# Altium project Industrial_IOT_Dev_Brd-v1.0.PrjPcb (part 1 of 7)
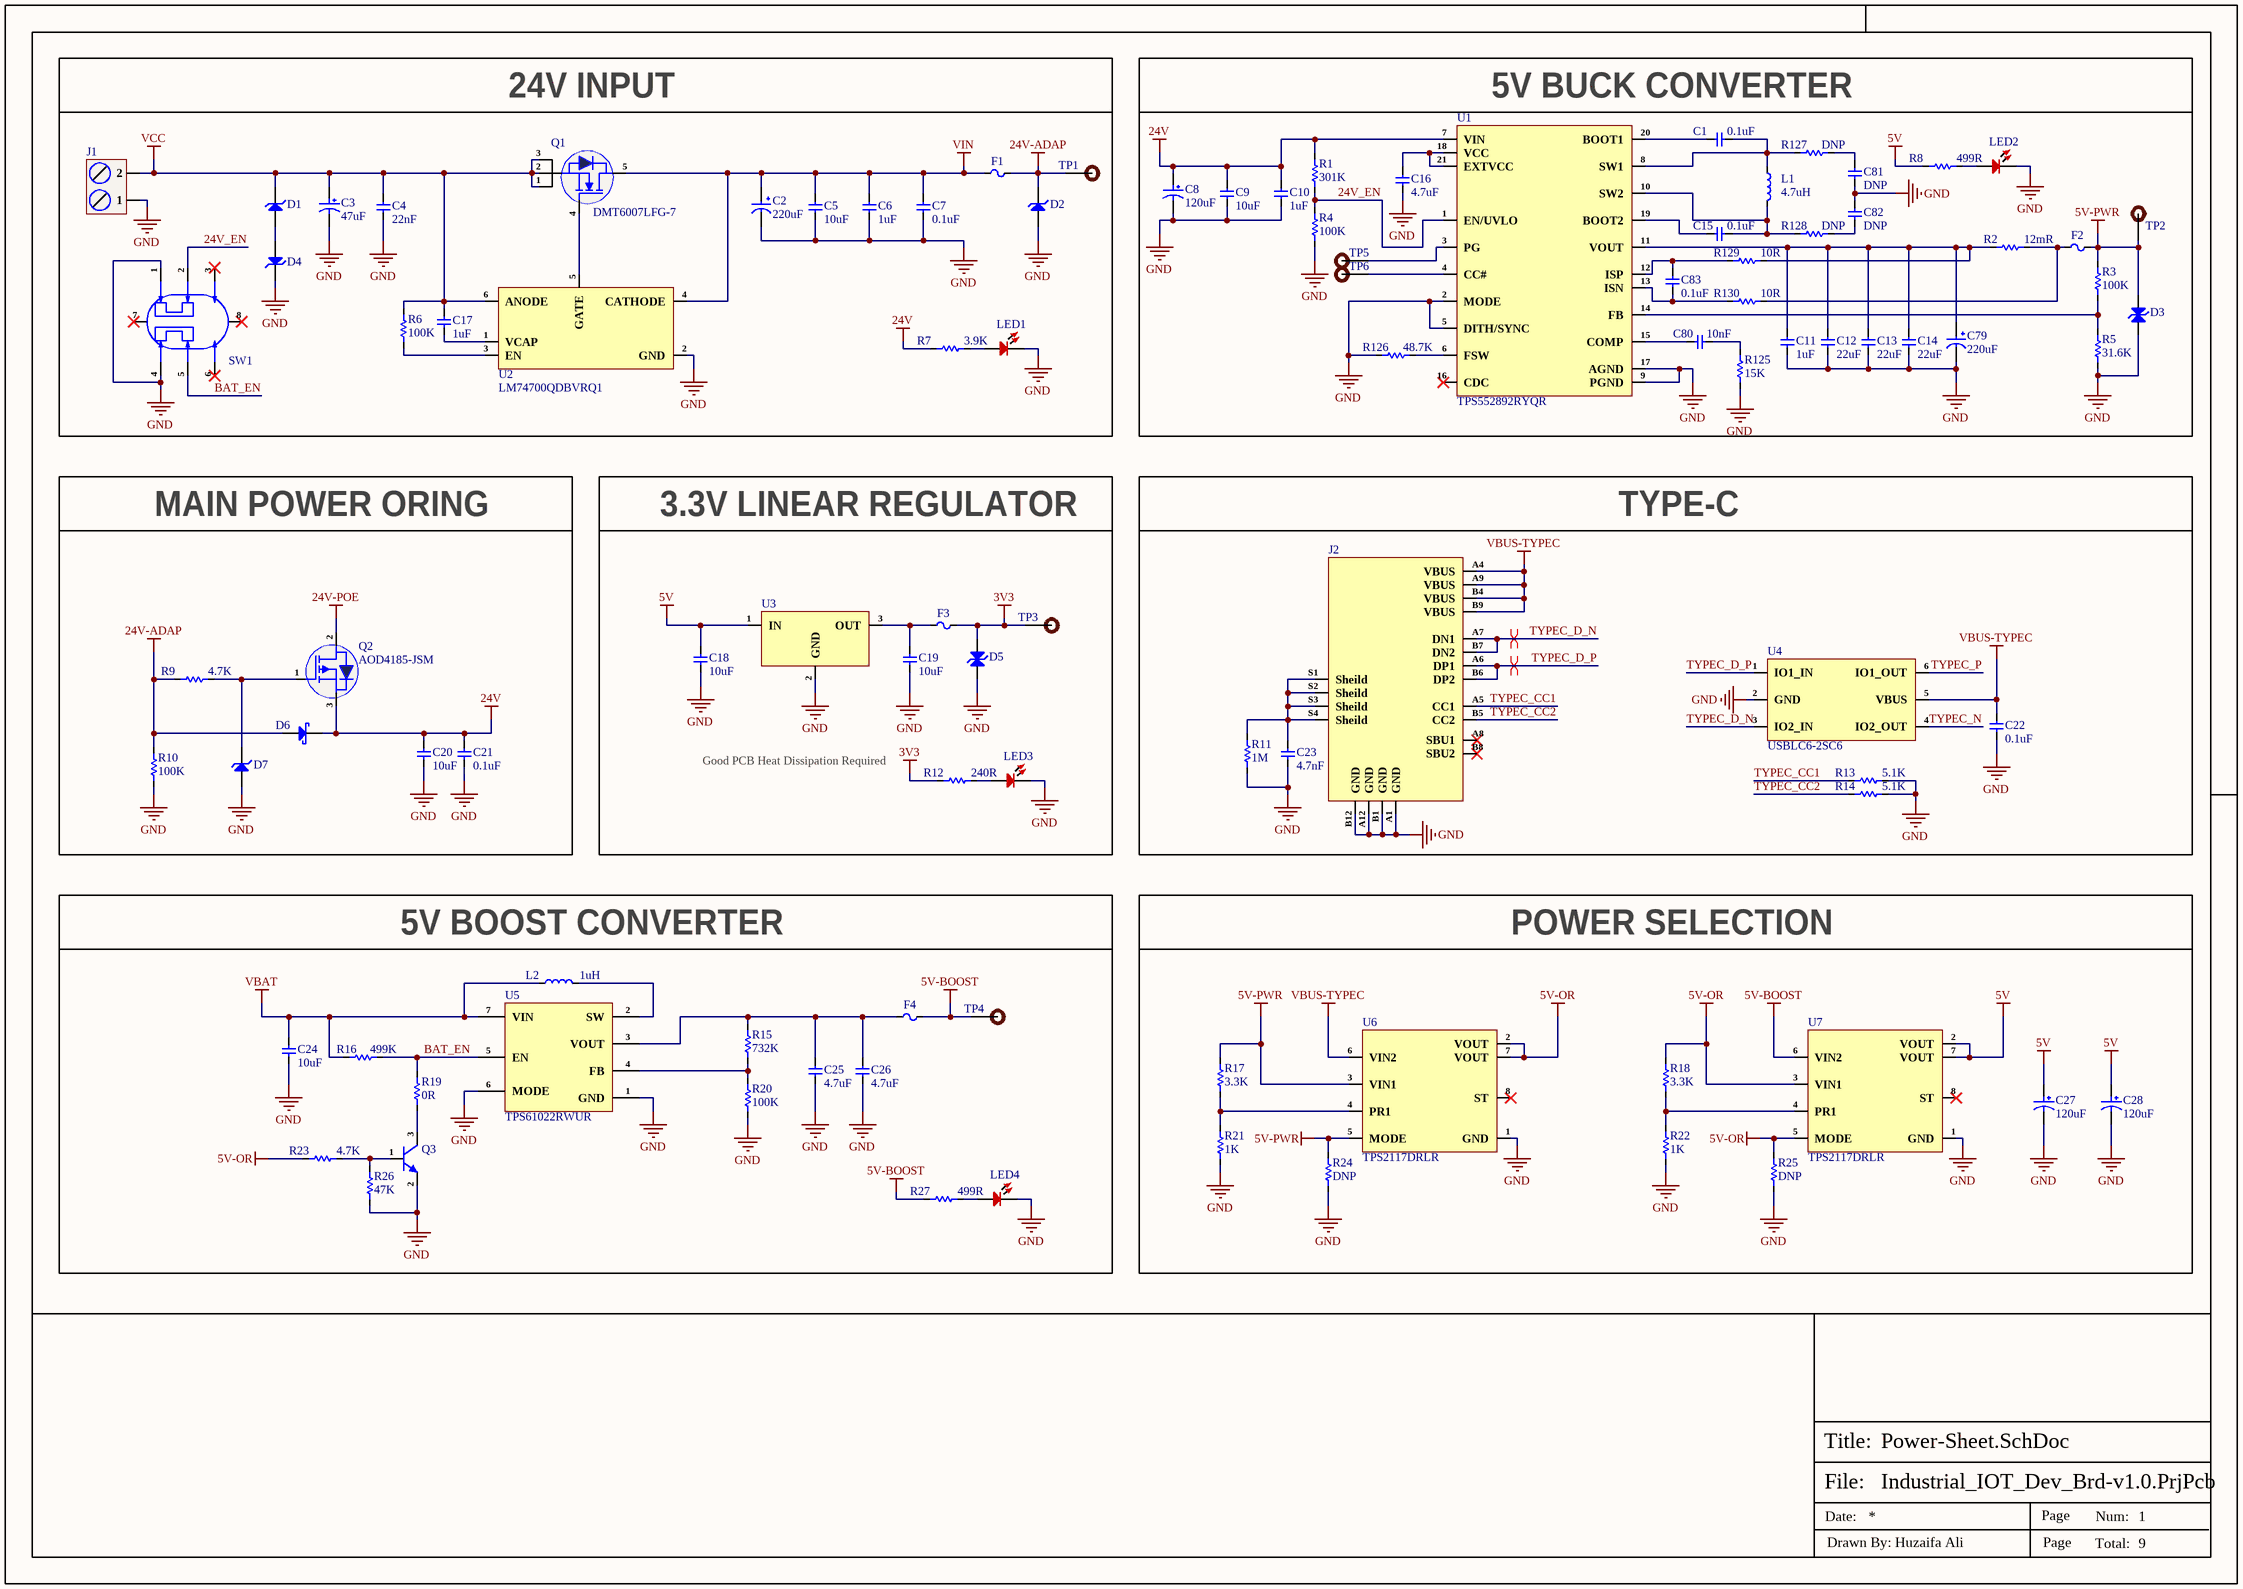
[diagram p0: Power-Sheet.SchDoc]
9 sheets, 376 parts. Net scope: global (net labels, ports and power ports of the same name join across sheets).
Board file: Industrial_IOT_Dev_Brd-v1.0.PcbDoc
Sheets:
  Power-Sheet.SchDoc
  Battery-Charging-Sheet.SchDoc
  Controller-Sheet.SchDoc
  Power-Relay-Sheet.SchDoc
  Terminal-Sheet.SchDoc
  Digital-Input-Sheet.SchDoc
  Analog-Input-Sheet.SchDoc
  Ethernet-PoE-Sheet.SchDoc
  RS485-Sheet.SchDoc

## Sheet Power-Sheet.SchDoc
size 420 x 297 mm; SheetNumber: 1; SheetTotal: 9

### Parts
C1  0.1uF  [Cap-0402]
C2  220uF  [UCD-220uF-10mmDia]
C3  47uF  [RVT1H470M0607]
C4  22nF  [Cap-0805]
C5  10uF  [Cap-1210]
C6  1uF  [Cap-0603]
C7  0.1uF  [Cap-0603]
C8  120uF  [OVZ121M1VTR-1013]
C9  10uF  [Cap-1210]
C10  1uF  [Cap-0603]
C11  1uF  [Cap-0603]
C12  22uF  [Cap-0805]
C13  22uF  [Cap-0805]
C14  22uF  [Cap-0805]
C15  0.1uF  [Cap-0402]
C16  4.7uF  [Cap-0805]
C17  1uF  [Cap-0603]
C18  10uF  [Cap-1210]
C19  10uF  [Cap-1210]
C20  10uF  [Cap-1210]
C21  0.1uF  [Cap-0603]
C22  0.1uF  [Cap-0402]
C23  4.7nF  [Cap-1206]
C24  10uF  [Cap-0603]
C25  4.7uF  [Cap-0603]
C26  4.7uF  [Cap-0603]
C27  120uF  [20SVPF120M]
C28  120uF  [20SVPF120M]
C79  220uF  [Case-E]
C80  10nF  [Cap-0603]
C81  DNP  [Cap-0603]
C82  DNP  [Cap-0603]
C83  0.1uF  [Cap-0603]
D1  SMBJ58A-13-F  [SMB_]  (value not drawn)
D2  AZ4024-01G  [SOD-123]  (value not drawn)
D3  PESD5V0S1BA,115-ES  [SOD-323 (Bi-directional)]  (value not drawn)
D4  SMBJ26A-13-F  [SMB_]  (value not drawn)
D5  PESD3V3L1BA-N-ES  [SOD-323 (Bi-directional)]  (value not drawn)
D6  PMEG4030ER  [SOD-123FL]  (value not drawn)
D7  1SMA5930BT3G  [SMA]  (value not drawn)
F1  1210L075/24PR  [FUSE-1210]  (value not drawn)
F2  BSMD1206-300-6V  [Fuse 1206 (3216 Metric)]  (value not drawn)
F3  SMD0805B110TF  [Fuse-0805]  (value not drawn)
F4  BSMD1206-300-6V  [Fuse 1206 (3216 Metric)]  (value not drawn)
J1  DB128L-5.08-2P-GN-S  [DB128L-5.08-2P-GN-S]  (value not drawn)
J2  U263-163N-4BQC65  [U263-163N-4BQC65]  (value not drawn)
L1  4.7uH  [YSPI1050-4R7M]
L2  1uH  [XFL4020-102MEC]
LED1  RED  [LED-0603]  (value not drawn)
LED2  RED  [LED-0603]  (value not drawn)
LED3  RED  [LED-0603]  (value not drawn)
LED4  RED  [LED-0603]  (value not drawn)
Q1  DMT6007LFG-7  [PowerDI-3333-8]
Q2  AOD4185-JSM  [TO-252-2L]
Q3  MMBT3904M  [SOT-723]  (value not drawn)
R1  301K  [res-0603]
R2  12mR  [RES-2512]
R3  100K  [Res-0402]
R4  100K  [Res-0603]
R5  31.6K  [Res-0402]
R6  100K  [Res-0603]
R7  3.9K  [Res-0402]
R8  499R  [Res-0402]
R9  4.7K  [Res-0402]
R10  100K  [Res-0603]
R11  1M  [Res-0603]
R12  240R  [Res-0402]
R13  5.1K  [Res-0402]
R14  5.1K  [Res-0402]
R15  732K  [Res-0603]
R16  499K  [Res-0603]
R17  3.3K  [Res-0402]
R18  3.3K  [Res-0402]
R19  0R  [Res-0402]
R20  100K  [Res-0603]
R21  1K  [Res-0402]
R22  1K  [Res-0402]
R23  4.7K  [Res-0402]
R24  DNP  [Res-0402]
R25  DNP  [Res-0402]
R26  47K  [Res-0402]
R27  499R  [Res-0402]
R125  15K  [Res-0603]
R126  48.7K  [Res-0603]
R127  DNP  [Res-0603]
R128  DNP  [Res-0603]
R129  10R  [Res-0603]
R130  10R  [Res-0603]
SW1  SS-22F07-G010  [SS-22F07-G010]  (value not drawn)
TP1  TEST POINT  [Test-point]  (value not drawn)  (no BOM)
TP2  TEST POINT  [Test-point]  (value not drawn)  (no BOM)
TP3  TEST POINT  [Test-point]  (value not drawn)  (no BOM)
TP4  TEST POINT  [Test-point]  (value not drawn)  (no BOM)
TP5  TEST POINT  [Test-point]  (value not drawn)  (no BOM)
TP6  TEST POINT  [Test-point]  (value not drawn)  (no BOM)
U1  TPS552892RYQR  [VQFN-HR-21(3x5)]
U2  LM74700QDBVRQ1  [SOT-23-6]
U3  AP7363-33D-13  [TO-252-2L]  (value not drawn)
U4  USBLC6-2SC6  [SOT-23-6]
U5  TPS61022RWUR  [7-VQFN-HR (2x2)]
U6  TPS2117DRLR  [SOT-583]
U7  TPS2117DRLR  [SOT-583]

### Blocks framed on the sheet
24V INPUT: C2-C7 C17 D1 D2 D4 F1 J1 LED1 Q1 R6 R7 SW1 TP1 U2
5V BUCK CONVERTER: C1 C8-C16 C79-C83 D3 F2 L1 LED2 R1-R5 R8 R125-R130 TP2 TP5 TP6 U1
MAIN POWER ORING: C20 C21 D6 D7 Q2 R9 R10
3.3V LINEAR REGULATOR: C18 C19 D5 F3 LED3 R12 TP3 U3
TYPE-C: C22 C23 J2 R11 R13 R14 U4
5V BOOST CONVERTER: C24-C26 F4 L2 LED4 Q3 R15 R16 R19 R20 R23 R26 R27 TP4 U5
POWER SELECTION: C27 C28 R17 R18 R21 R22 R24 R25 U6 U7

### Nets
3V3: D5.2(A) F3.2 R12.1 TP3.1
5V: C18.2 C27.1 C28.1 R8.1 U3.1(IN) U7.2(VOUT) U7.7(VOUT)
5V-BOOST: F4.2 R27.1 TP4.1 U7.6(VIN2)
5V-OR: R18.2 R23.1 R25.2 U6.2(VOUT) U6.7(VOUT) U7.3(VIN1) U7.5(MODE)
5V-PWR: D3.2(A) F2.2 R3.2 R17.2 R24.2 TP2.1 U6.3(VIN1) U6.5(MODE)
24V: C8.1 C9.2 C10.2 C20.2 C21.2 D6.1(K) Q2.3(S) R1.2 R7.1 U1.7(VIN)
24V-ADAP: D2.2(K) D6.2(A) F1.2 R9.2 R10.2 TP1.1
24V-POE: Q2.2(D)
GND: C2.2 C3.2 C4.1 C5.1 C6.1 C7.1 C8.2 C9.1 C10.1 C11.1 C12.1 C13.1 C14.1 C16.1 C18.1 C19.1 C20.1 C21.1 C22.2 C23.1 C24.1 C25.1 C26.1 C27.2 C28.2 C79.2 C81.1 C82.2 D2.1(A) D3.1(A) D4.2(K) D5.1(A) D7.2(A) J1.1 J2.A1(GND) J2.A12(GND) J2.B1(GND) J2.B12(GND) LED1.2 LED2.2 LED3.2 LED4.2 Q3.2(E) R4.1 R5.1 R10.1 R11.1 R13.2 R14.2 R20.1 R21.1 R22.1 R24.1 R25.1 R26.1 R125.1 R126.1 SW1.1 SW1.4 U1.2(MODE) U1.5(DITH/SYNC) U1.9(PGND) U1.17(AGND) U2.2(GND) U3.2(GND) U4.2(GND) U5.1(GND) U5.6(MODE) U6.1(GND) U7.1(GND)
VBAT: C24.2 L2.1 R16.1 U5.7(VIN)
VBUS-TYPEC: C22.1 J2.A4(VBUS) J2.A9(VBUS) J2.B4(VBUS) J2.B9(VBUS) U4.5(VBUS) U6.6(VIN2)
VCC: C3.1 C4.2 C17.2 D1.2(K) J1.2 Q1.1(S) Q1.2(S) Q1.3(S) R6.1 U2.6(ANODE)
VIN: C2.1 C5.2 C6.2 C7.2 F1.1 Q1.5(D) U2.4(CATHODE)
24V_EN: R1.1 R4.2 SW1.2 U1.1(EN/UVLO)
BAT_EN: R16.2 R19.2 SW1.5 U5.5(EN)
TYPEC_CC1: J2.A5(CC1) R13.1
TYPEC_CC2: J2.B5(CC2) R14.1
TYPEC_D_N: J2.A7(DN1) J2.B7(DN2) U4.3(IO2_IN)
TYPEC_D_P: J2.A6(DP1) J2.B6(DP2) U4.1(IO1_IN)
TYPEC_N: U4.4(IO2_OUT)
TYPEC_P: U4.6(IO1_OUT)
NetC1_1: C1.1 U1.20(BOOT1)
NetC1_2: C1.2 L1.1 R127.1 U1.8(SW1)
NetC11_2: C11.2 C12.2 C13.2 C14.2 C79.1 R2.1 R129.2 U1.11(VOUT)
NetC15_1: C15.1 U1.19(BOOT2)
NetC15_2: C15.2 L1.2 R128.1 U1.10(SW2)
NetC16_2: C16.2 U1.18(VCC) U1.21(EXTVCC)
NetC17_1: C17.1 U2.1(VCAP)
NetC19_2: C19.2 F3.1 U3.3(OUT)
NetC23_2: C23.2 J2.S1(Sheild) J2.S2(Sheild) J2.S3(Sheild) J2.S4(Sheild) R11.2
NetC25_2: C25.2 C26.2 F4.1 R15.2 U5.3(VOUT)
NetC80_1: C80.1 R125.2
NetC80_2: C80.2 U1.15(COMP)
NetC81_2: C81.2 R127.2
NetC82_1: C82.1 R128.2
NetC83_1: C83.1 R130.1 U1.13(ISN)
NetC83_2: C83.2 R129.1 U1.12(ISP)
NetD1_1: D1.1(A) D4.1(A)
NetD7_1: D7.1(K) Q2.1(G) R9.1
NetF2_1: F2.1 R2.2 R130.2
NetL2_2: L2.2 U5.2(SW)
NetLED1_1: LED1.1 R7.2
NetLED2_1: LED2.1 R8.2
NetLED3_1: LED3.1 R12.2
NetLED4_1: LED4.1 R27.2
NetQ1_4: Q1.4(G) U2.5(GATE)
NetQ3_1: Q3.1(B) R23.2 R26.2
NetQ3_3: Q3.3(C) R19.1
NetR3_1: R3.1 R5.2 U1.14(FB)
NetR6_2: R6.2 U2.3(EN)
NetR15_1: R15.1 R20.2 U5.4(FB)
NetR17_1: R17.1 R21.2 U6.4(PR1)
NetR18_1: R18.1 R22.2 U7.4(PR1)
NetR126_2: R126.2 U1.6(FSW)
NetTP5_1: TP5.1 U1.3(PG)
NetTP6_1: TP6.1 U1.4(CC#)

Not connected (* = marked no-connect by the designer): J2 A8(SBU1)* B8(SBU2)*; SW1 3* 6* 7* 8*; U1 16(CDC)*; U6 8(ST)*; U7 8(ST)*

### Layout directives
differential pair; differential pair class USB: TYPEC_D_N, TYPEC_D_P

### Notes on the sheet
- (near R12) Good PCB Heat Dissipation Required
- File:
- Title:
- Date:
- Page
- Num:
- Total:
- Drawn By: Huzaifa Ali